# EAGLE design ICM-20948-breakout (EAGLE 9.6.1)
REVISION: 1.0; SCH_DESC: Breakout board for the LSM9DS1; TEAM: RoboCup
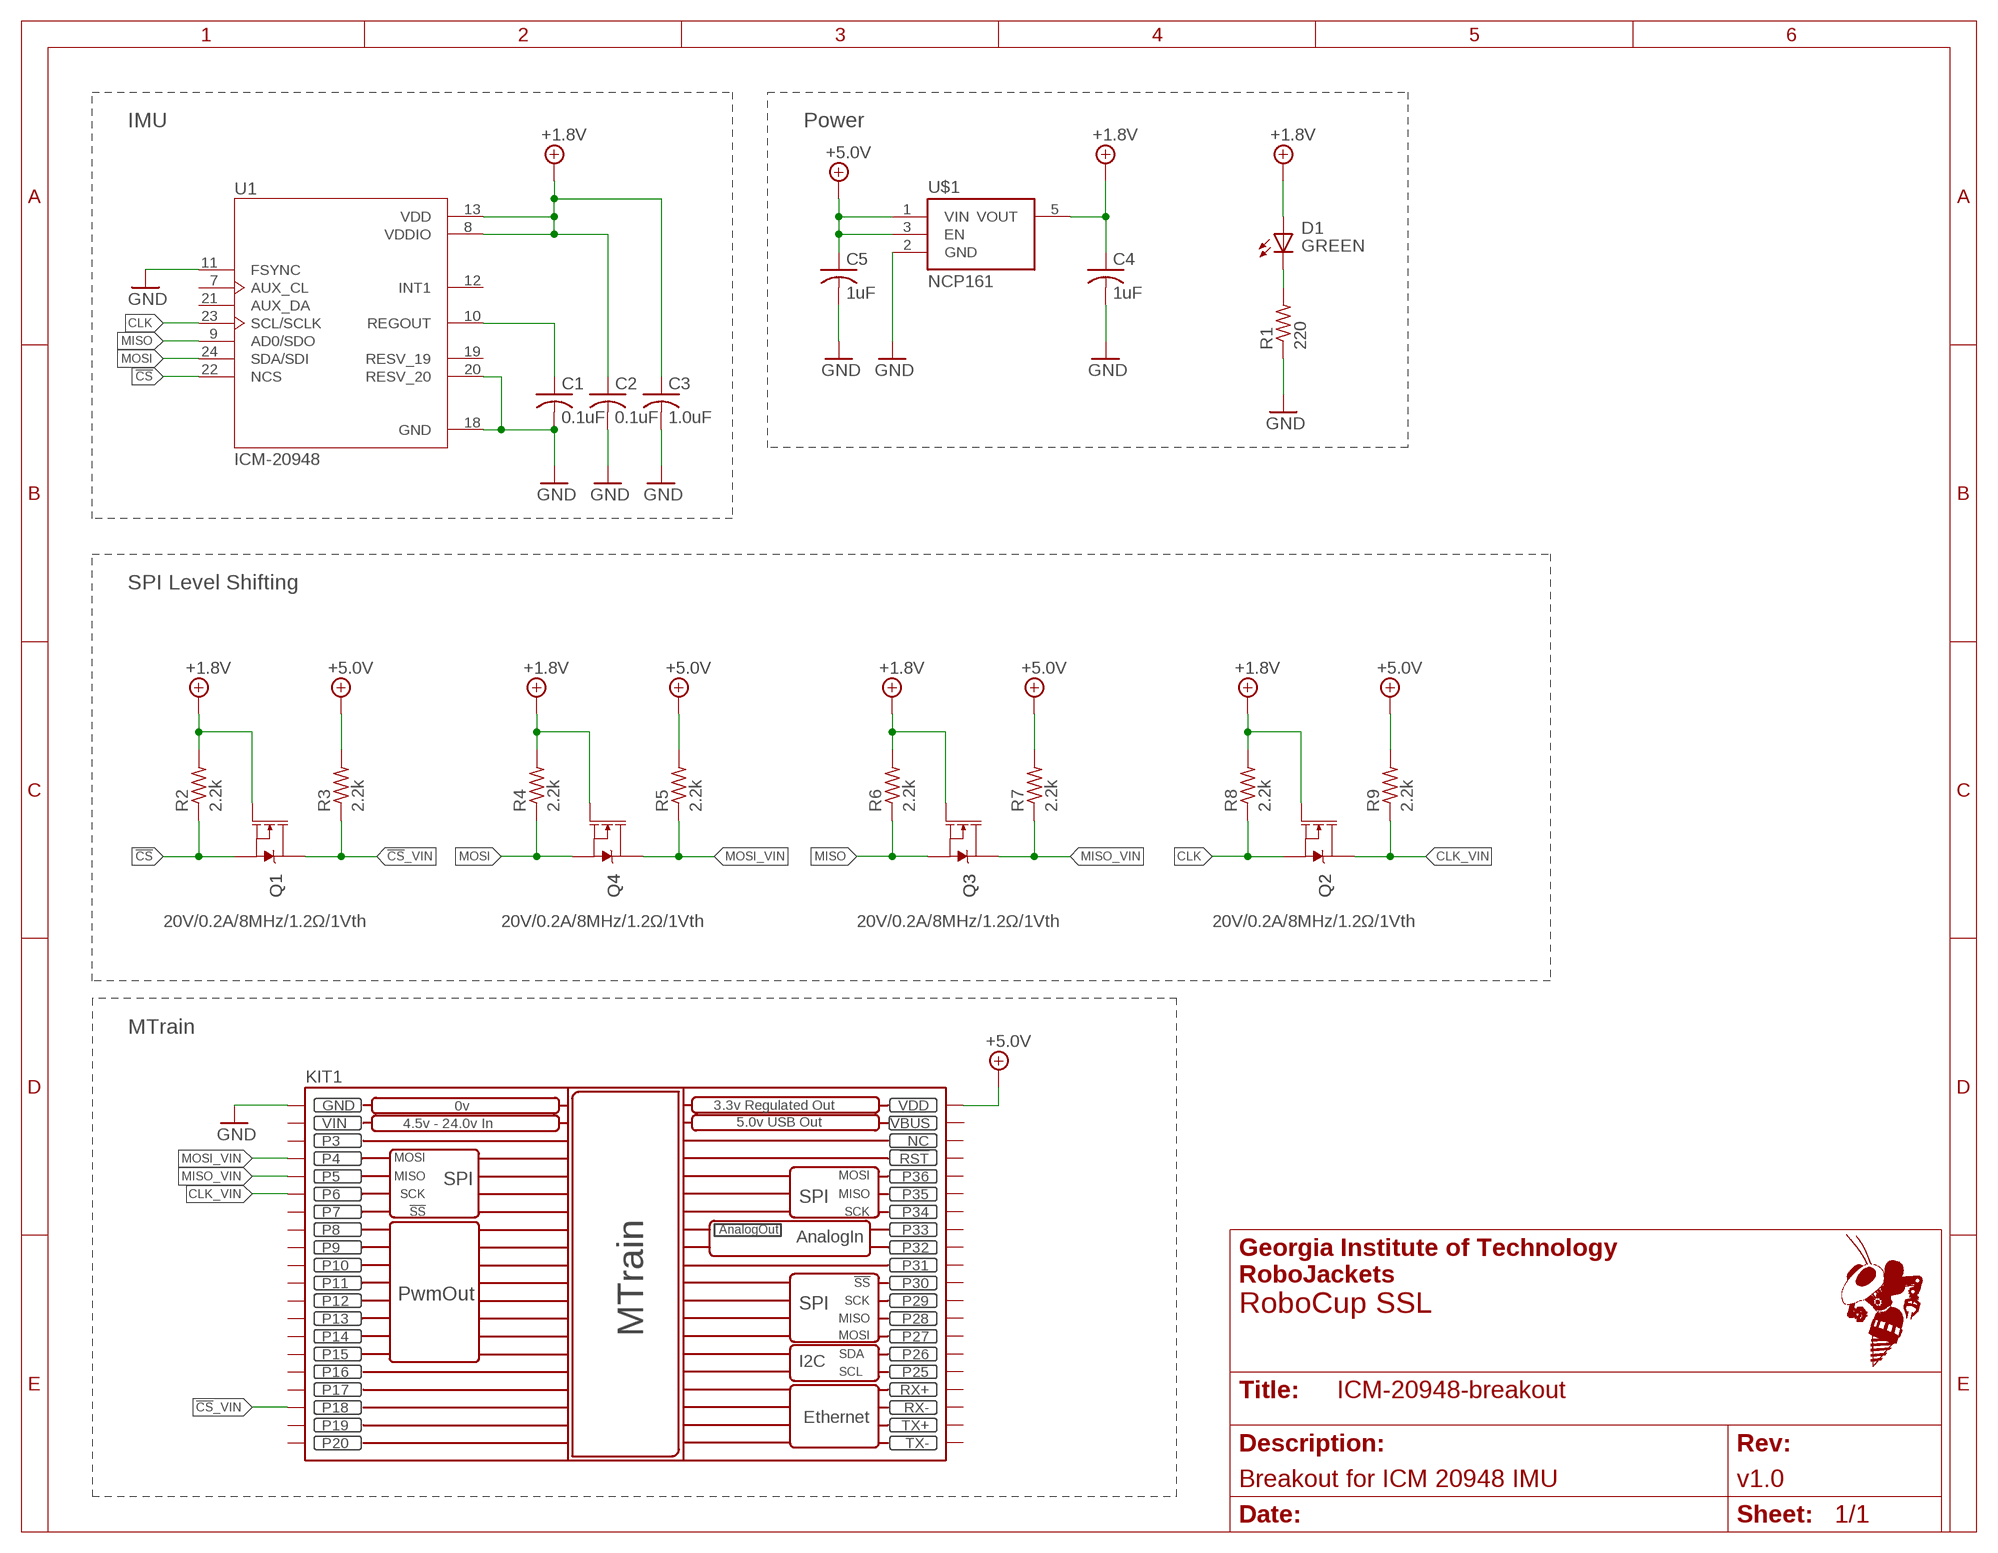
[diagram p0: schematic, sheet 1]
FRAME1 (FRAME_A_L): REVISION: v1.0; SCH_DESC: Breakout for ICM 20948 IMU; TEAM: RoboCup SSL

## Parts
C1  0.1uF  C-USC0603  [C0603]
C2  0.1uF  C-USC0603  [C0603]
C3  1.0uF  C-USC0603  [C0603]
C4  1uF  C-USC0603  [C0603]
C5  1uF  C-USC0603  [C0603]
D1  GREEN  LED-SMD-GREEN  [CHIP-LED0603]
KIT1  MTRAIN  [MTRAIN-KIT]
Q1  20V/0.2A/8MHz/1.2Ω/1Vth  MOSFET-NCH-RE1C002UN  [SOT-416FL]
Q2  20V/0.2A/8MHz/1.2Ω/1Vth  MOSFET-NCH-RE1C002UN  [SOT-416FL]
Q3  20V/0.2A/8MHz/1.2Ω/1Vth  MOSFET-NCH-RE1C002UN  [SOT-416FL]
Q4  20V/0.2A/8MHz/1.2Ω/1Vth  MOSFET-NCH-RE1C002UN  [SOT-416FL]
R1  220  R0603W  [R0603W]
R2  2.2k  R0603W  [R0603W]
R3  2.2k  R0603W  [R0603W]
R4  2.2k  R0603W  [R0603W]
R5  2.2k  R0603W  [R0603W]
R6  2.2k  R0603W  [R0603W]
R7  2.2k  R0603W  [R0603W]
R8  2.2k  R0603W  [R0603W]
R9  2.2k  R0603W  [R0603W]
U1  ICM-20948  ICM-20948ICM-20948  [ICM-20948]
U$1  NCP161  [SOT-23-5]

## Nets
!CS!: Q1.2(S) R2.1(PIN1) U1.22(NCS)
!CS!_VIN: KIT1.P$18(P18) Q1.3(D) R3.1(PIN1)
+1.8V: C2.1 C3.1 C4.1 D1.A Q1.1(G) Q2.1(G) Q3.1(G) Q4.1(G) R2.2(PIN2) R4.2(PIN2) R6.2(PIN2) R8.2(PIN2) U1.8(VDDIO) U1.13(VDD) U$1.5(VOUT)
+3.3V: C5.1 R3.2(PIN2) R5.2(PIN2) R7.2(PIN2) R9.2(PIN2) U$1.1(VIN) U$1.3(EN) ; supply symbol labelled +5.0V
+5.0V: KIT1.VDD
CLK: Q2.2(S) R8.1(PIN1) U1.23(SCL/SCLK)
CLK_VIN: KIT1.P$6(P6) Q2.3(D) R9.1(PIN1)
GND: C1.2 C2.2 C3.2 C4.2 C5.2 KIT1.GND R1.1(PIN1) U1.11(FSYNC) U1.18(GND) U1.20(RESV_20) U$1.2(GND)
MISO: Q3.2(S) R6.1(PIN1) U1.9(AD0/SDO)
MISO_VIN: KIT1.P$5(P5) Q3.3(D) R7.1(PIN1)
MOSI: Q4.2(S) R4.1(PIN1) U1.24(SDA/SDI)
MOSI_VIN: KIT1.P$4(P4) Q4.3(D) R5.1(PIN1)
N$1: D1.C(K) R1.2(PIN2)
REGOUT: C1.1 U1.10(REGOUT)
Unconnected: KIT1.!RST KIT1.NC KIT1.P$3(P3) KIT1.P$7(P7) KIT1.P$8(P8) KIT1.P$9(P9) KIT1.P$10(P10) KIT1.P$11(P11) KIT1.P$12(P12) KIT1.P$13(P13) KIT1.P$14(P14) KIT1.P$15(P15) KIT1.P$16(P16) KIT1.P$17(P17) KIT1.P$19(P19) KIT1.P$20(P20) KIT1.P$25(P25) KIT1.P$26(P26) KIT1.P$27(P27) KIT1.P$28(P28) KIT1.P$29(P29) KIT1.P$30(P30) KIT1.P$31(P31) KIT1.P$32(P32) KIT1.P$33(P33) KIT1.P$34(P34) KIT1.P$35(P35) KIT1.P$36(P36) KIT1.RX+ KIT1.RX- KIT1.TX+ KIT1.TX- U1.7(AUX_CL) U1.12(INT1) U1.19(RESV_19) U1.21(AUX_DA)

## Notes on the sheet
- IMU | Power
- SPI Level Shifting
- MTrain

## Power pins joined to a net without a drawn wire
VBUS: KIT1.VBUS
VIN: KIT1.VIN

## Library data of the parts
C1-C5 = rcl:C-US: CAPACITOR, American symbol; SPICEPREFIX: C
D1 = RoboJackets-LEDs:LED-SMD; DIGIKEY: 160-1446-1-ND; MPN: LTST-C191KGKT
KIT1 = RoboJackets-Boards:MTRAIN: MTrain created by Evan Peterson
Q1-Q4 = RoboJackets-Discrete:MOSFET-NCH: N-channel MOSFETs Voltage controlled devices that allow control of high current outputs. SparkFun Products: SparkFun OpenScale <https://www.sparkfun.com/products/13261> SparkFun Digital Sandbox <https://www.sparkfun.com/products/12651> SparkFun Monster Moto Shield <https://www.sparkfun.com/products/10182> SparkFun MOSFET Power Controller <https://www.sparkfun.com/products/11214>; PROD_ID: TRANS_14399
R1-R9 = RoboJackets-Resistors:R0603W
U1 = RoboJackets-Sensors:ICM-20948: Axis=3 Axis Gyro+3 Axis Accel+Compass. Pin For Pin With m
U$1 = RoboJackets-PowerICs:NCP161: NCP161 LDO linear regulator capable of supplying 450 mA output current for Vin less than or equal to +6V Vout = 1.8V / 2.5V / 3.3V / 5.14V Datasheet: https://www.onsemi.com/pub/Collateral/NCP161-D.PDF

## Board
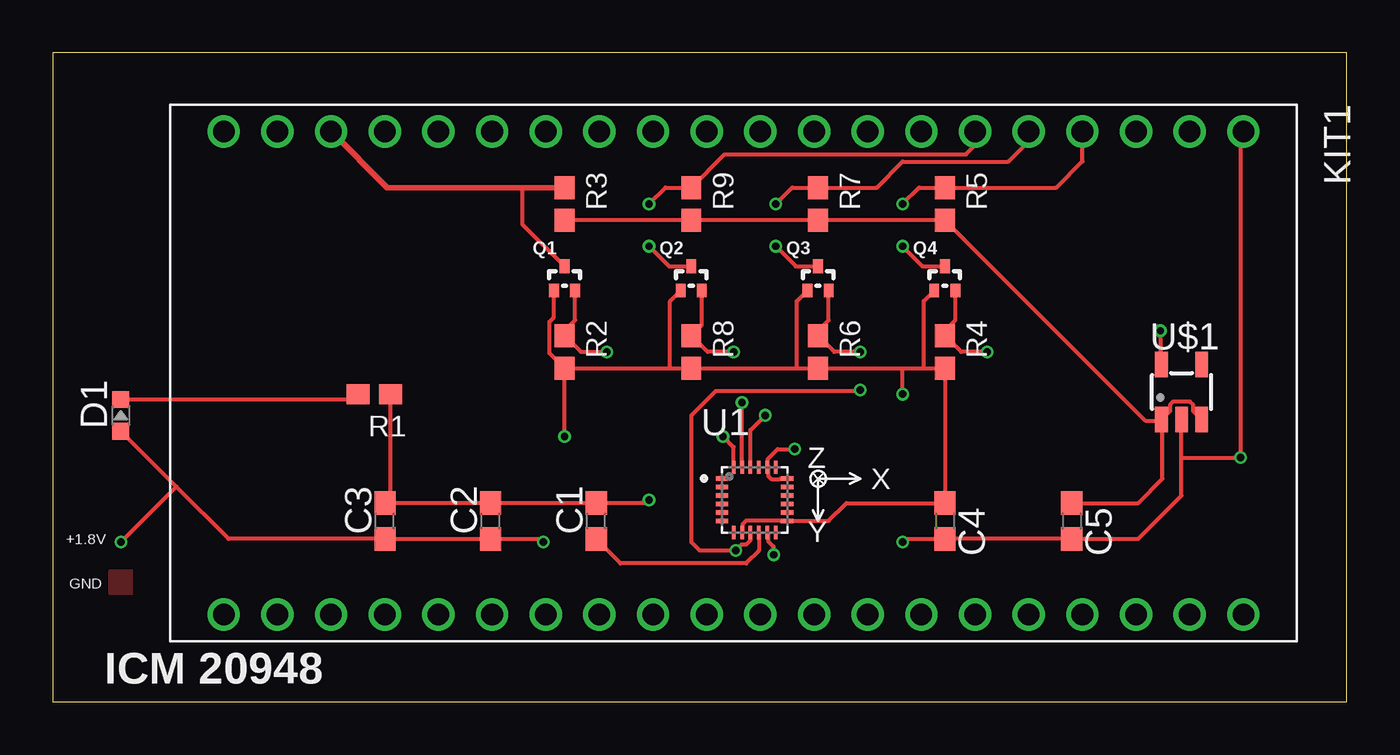
[diagram p1: board, top side]
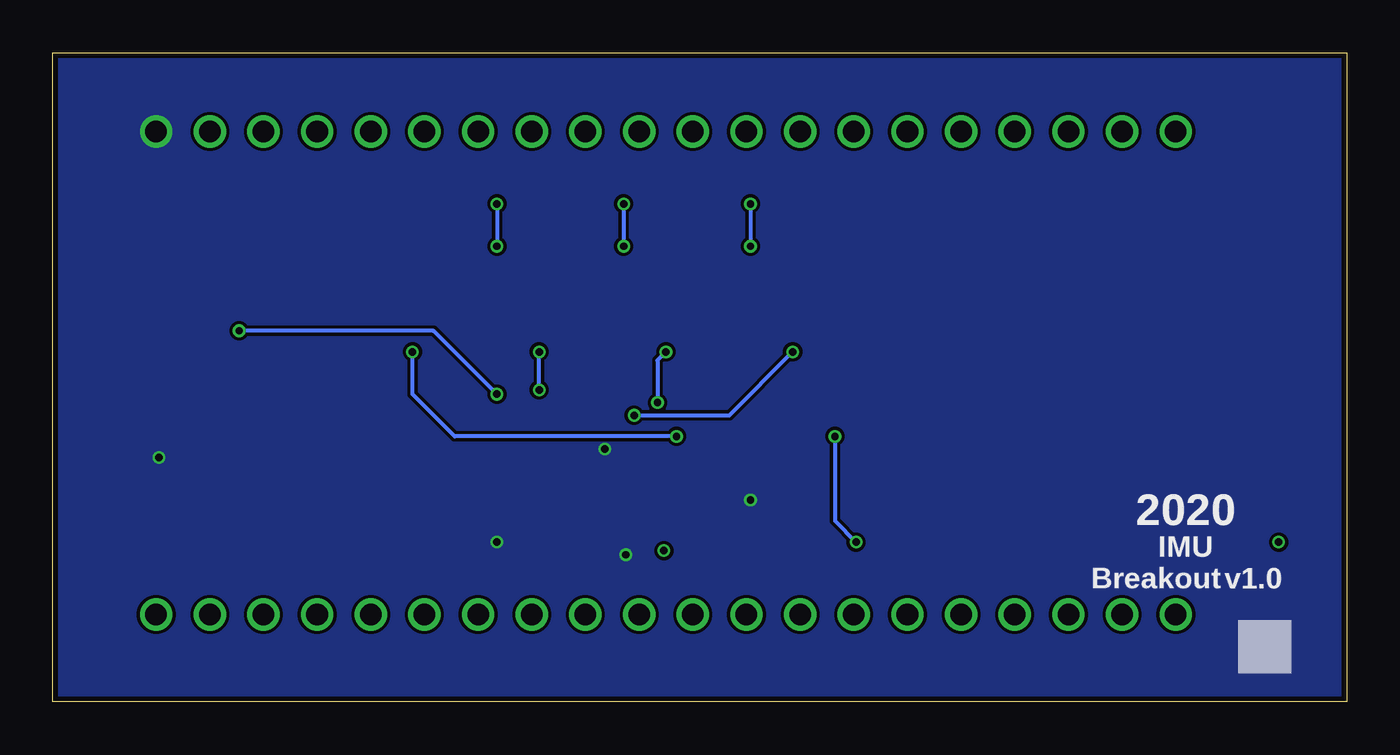
[diagram p2: board, bottom side, seen from below]

Size 61.24 x 30.7 mm. Coordinates in mm from the lower left corner, seen from the top.
Outline: 0,0 61.24,0 61.24,30.7 0,30.7 0,0
Copper layers (1*16): Top 0.018mm / dielectric 1.55mm / Bottom 0.018mm
Design rules "eC_2Layer_PClass6_BaseCopperO18_eCDefault": minimum track width 0.15mm, minimum drill 0.35mm, track to track 0.15mm, track to pad 0.15mm, pad to pad 0.15mm, via to via 0.15mm, smd to smd 0mil, copper to edge 0.25mm, drill to drill 0.35mm, minimum pad ring 0.175mm, minimum via ring 0.125mm, stop-mask expansion 0mil, vias tented up to drill 0.45mm, thermal gap 0.2mm

### Footprints (pad centres in the part's own frame; a part is rotated, then mirrored left to right if it is on the bottom)
C0603 = smd 1.1 x 1: 1 -0.85,0; 2 0.85,0
CHIP-LED0603 = smd 0.8 x 0.8: A 0,-0.75; C 0,0.75
MTRAIN-KIT = drill 1.02: !RST 11.43,16.51; GND -11.43,24.13; NC 11.43,19.05; P$3 -11.43,19.05; P$4 -11.43,16.51; P$5 -11.43,13.97; P$6 -11.43,11.43; P$7 -11.43,8.89; P$8 -11.43,6.35; P$9 -11.43,3.81; P$10 -11.43,1.27; P$11 -11.43,-1.27; P$12 -11.43,-3.81; P$13 -11.43,-6.35; P$14 -11.43,-8.89; P$15 -11.43,-11.43; P$16 -11.43,-13.97; P$17 -11.43,-16.51; P$18 -11.43,-19.05; P$19 -11.43,-21.59; P$20 -11.43,-24.13; P$25 11.43,-13.97; P$26 11.43,-11.43; P$27 11.43,-8.89; P$28 11.43,-6.35; P$29 11.43,-3.81; P$30 11.43,-1.27; P$31 11.43,1.27; P$32 11.43,3.81; P$33 11.43,6.35; P$34 11.43,8.89; P$35 11.43,11.43; P$36 11.43,13.97; RX+ 11.43,-16.51; RX- 11.43,-19.05; TX+ 11.43,-21.59; TX- 11.43,-24.13; VBUS 11.43,21.59; VDD 11.43,24.13; VIN -11.43,21.59
SOT-416FL = smd 0.46 x 0.65: 1 -0.5,-1.1; 2 0.5,-1.1; 3 0,0.05
R0603W = smd 1.09 x 0.94: 1 -0.775,0; 2 0.775,0
ICM-20948 = smd 0.64 x 0.22: 1 -1.545,1; 2 -1.545,0.6; 3 -1.545,0.2; 4 -1.545,-0.2; 5 -1.545,-0.6; 6 -1.545,-1; 13 1.545,-1; 14 1.545,-0.6; 15 1.545,-0.2; 16 1.545,0.2; 17 1.545,0.6; 18 1.545,1 | smd 0.22 x 0.64: 7 -1,-1.545; 8 -0.6,-1.545; 9 -0.2,-1.545; 10 0.2,-1.545; 11 0.6,-1.545; 12 1,-1.545; 19 1,1.545; 20 0.6,1.545; 21 0.2,1.545; 22 -0.2,1.545; 23 -0.6,1.545; 24 -1,1.545
SOT-23-5 = smd 0.6 x 1.2: 1 -0.95,-1.306; 2 0,-1.306; 3 0.95,-1.306; 4 0.95,1.306; 5 -0.95,1.306

### Placement (x,y rotation side)
C1  25.72,8.55 90 top
C2  20.72,8.55 90 top
C3  15.72,8.55 90 top
C4  42.22,8.55 270 top
C5  48.22,8.55 270 top
D1  3.22,13.55 0 top
KIT1  32.22,15.55 270 top
Q1  24.22,20.55 0 top
Q2  30.22,20.55 0 top
Q3  36.22,20.55 0 top
Q4  42.22,20.55 0 top
R1  15.22,14.55 180 top
R2  24.22,16.55 270 top
R3  24.22,23.55 270 top
R4  42.22,16.55 270 top
R5  42.22,23.55 270 top
R6  36.22,16.55 270 top
R7  36.22,23.55 270 top
R8  30.22,16.55 270 top
R9  30.22,23.55 270 top
U1  33.22,9.55 0 top
U$1  53.42,14.65 0 top

### Tracks (layer width: path | path; a pad name or v marks a point on that pad's centre or on a via)
!CS!  (via drill 0.35)
  Top 0.2: Q1.2 24.72,18.05 24.22,17.55 R2.1 25,16.55 v26.22,16.55 | U1.22 33.02,12.85 v33.72,13.55
  Bottom 0.2: v33.72,13.55 29.22,13.55 v26.22,16.55
!CS!_VIN
  Top 0.2: 22.22,24.33 22.22,22.6 Q1.3
  Top 0.254: KIT1.P$18 15.82,24.33 22.22,24.33 R3.1
+1.8V  (via drill 0.35)
  Top 0.2: 5.85,10.18 8.32,7.7 C3.1 C2.1 23.07,7.7 v23.22,7.55 | 5.85,10.18 D1.A | R2.2 29.22,15.78 | 29.22,15.78 R8.2 35.22,15.78 | 35.22,15.78 R6.2 40.22,15.78 | 40.22,15.78 41.22,15.78 | 41.22,15.78 R4.2 C4.1 37.57,9.4 36.72,8.55 U1.13 34.44,8.55 34.42,8.57 32.82,8.57 32.66,8.41 32.66,8.04 U1.8 32.66,7.96 | 41.22,15.78 41.22,18.95 Q4.1 | 35.22,15.78 35.22,18.95 Q3.1 | 29.22,15.78 29.22,18.95 Q2.1 | Q1.1 23.72,18.19 23.5,17.97 23.5,16.49 R2.2 | v24.22,12.55 R2.2 | v40.22,14.55 40.22,15.78 | v52.42,17.55 52.42,16.01 U$1.5 | v3.22,7.55 5.85,10.18
  Bottom 0.2: v40.22,14.55 43.22,17.55 v52.42,17.55 | v24.22,12.55 24.22,8.55 v23.22,7.55
+3.3V
  Top 0.2: R3.2 R9.2 R7.2 R5.2 51.7,13.29 52.52,13.29 | U$1.3 53.97,13.74 53.97,14.05 53.82,14.19 53.02,14.19 52.87,14.05 52.87,13.74 U$1.1 52.52,13.29 | C5.1 51.37,9.4 52.52,10.55 52.52,13.29
CLK  (via drill 0.35)
  Top 0.2: Q2.2 30.72,17.82 R8.1 31,16.55 v32.22,16.55 | U1.23 v32.62,14.15
  Bottom 0.2: v32.62,14.15 32.62,16.15 v32.22,16.55
CLK_VIN  (via drill 0.35)
  Top 0.2: KIT1.P$6 43.65,26.33 43.22,25.9 31.8,25.9 R9.1 29,24.33 v28.22,23.55 | v28.22,21.55 29.17,20.6 Q2.3
  Bottom 0.2: v28.22,23.55 v28.22,21.55
GND  (via drill 0.35)
  Top 0.2: U1.18 34.44,10.55 34.42,10.52 34.02,10.52 33.86,10.69 33.86,11.05 U1.20 33.86,11.13 33.86,11.5 34.31,11.95 v35.12,11.95 | U1.11 33.86,7.96 33.86,7.6 34.12,7.34 v34.12,6.95 | v28.22,9.55 28.07,9.4 C1.2 C2.2 C3.2 16,9.68 R1.1 | v40.22,7.55 40.37,7.7 C4.2 C5.2 51.37,7.7 53.42,9.75 53.42,11.55 | 53.42,11.55 U$1.2 | 53.42,11.55 v56.22,11.55 56.22,26.85 KIT1.GND
  pour Bottom (no thermals): 0,30.7 61.24,30.7 61.24,0 0,0
  pour Top: 2.72,6.15 2.72,5.15 3.72,5.15 3.72,6.15
MISO  (via drill 0.35)
  Top 0.2: Q3.2 36.72,18.05 36.22,17.55 R6.1 36.99,16.55 v38.22,16.55 | U1.9 33.02,7.64 32.82,7.43 32.6,7.43 v32.32,7.15 30.62,7.15 30.22,7.55 30.22,13.55 31.37,14.7 38.17,14.7 v38.22,14.75
  Bottom 0.2: v38.22,14.75 v38.22,16.55
MISO_VIN  (via drill 0.35)
  Top 0.2: KIT1.P$5 46.19,26.52 45.22,25.55 40.22,25.55 38.99,24.33 R7.1 34.99,24.33 v34.22,23.55 | v34.22,21.55 35.17,20.6 Q3.3
  Bottom 0.2: v34.22,23.55 v34.22,21.55
MOSI  (via drill 0.35)
  Top 0.2: Q4.2 42.72,18.05 42.22,17.55 R4.1 42.99,16.55 v44.22,16.55 | U1.24 32.22,12.05 v31.72,12.55
  Bottom 0.2: v31.72,12.55 42.22,12.55 44.22,14.55 v44.22,16.55
MOSI_VIN  (via drill 0.35)
  Top 0.2: KIT1.P$4 48.73,25.56 47.49,24.33 R5.1 40.99,24.33 v40.22,23.55 | v40.22,21.55 41.17,20.6 Q4.3
  Bottom 0.2: v40.22,23.55 v40.22,21.55
N$1
  Top 0.2: D1.C 14.2,14.3 R1.2
REGOUT
  Top 0.2: 33.43,7.99 U1.10 33.42,7.15 32.82,6.55 26.87,6.55 C1.1

### Text on the board
tPlace: ICM 20948
bPlace: 2020 | IMU / Breakout
tNames: +1.8V | GND